# Altium schematic sheet Capacitor_Bank.SchDoc
size A3; SheetNumber: 2; SheetTotal: 2
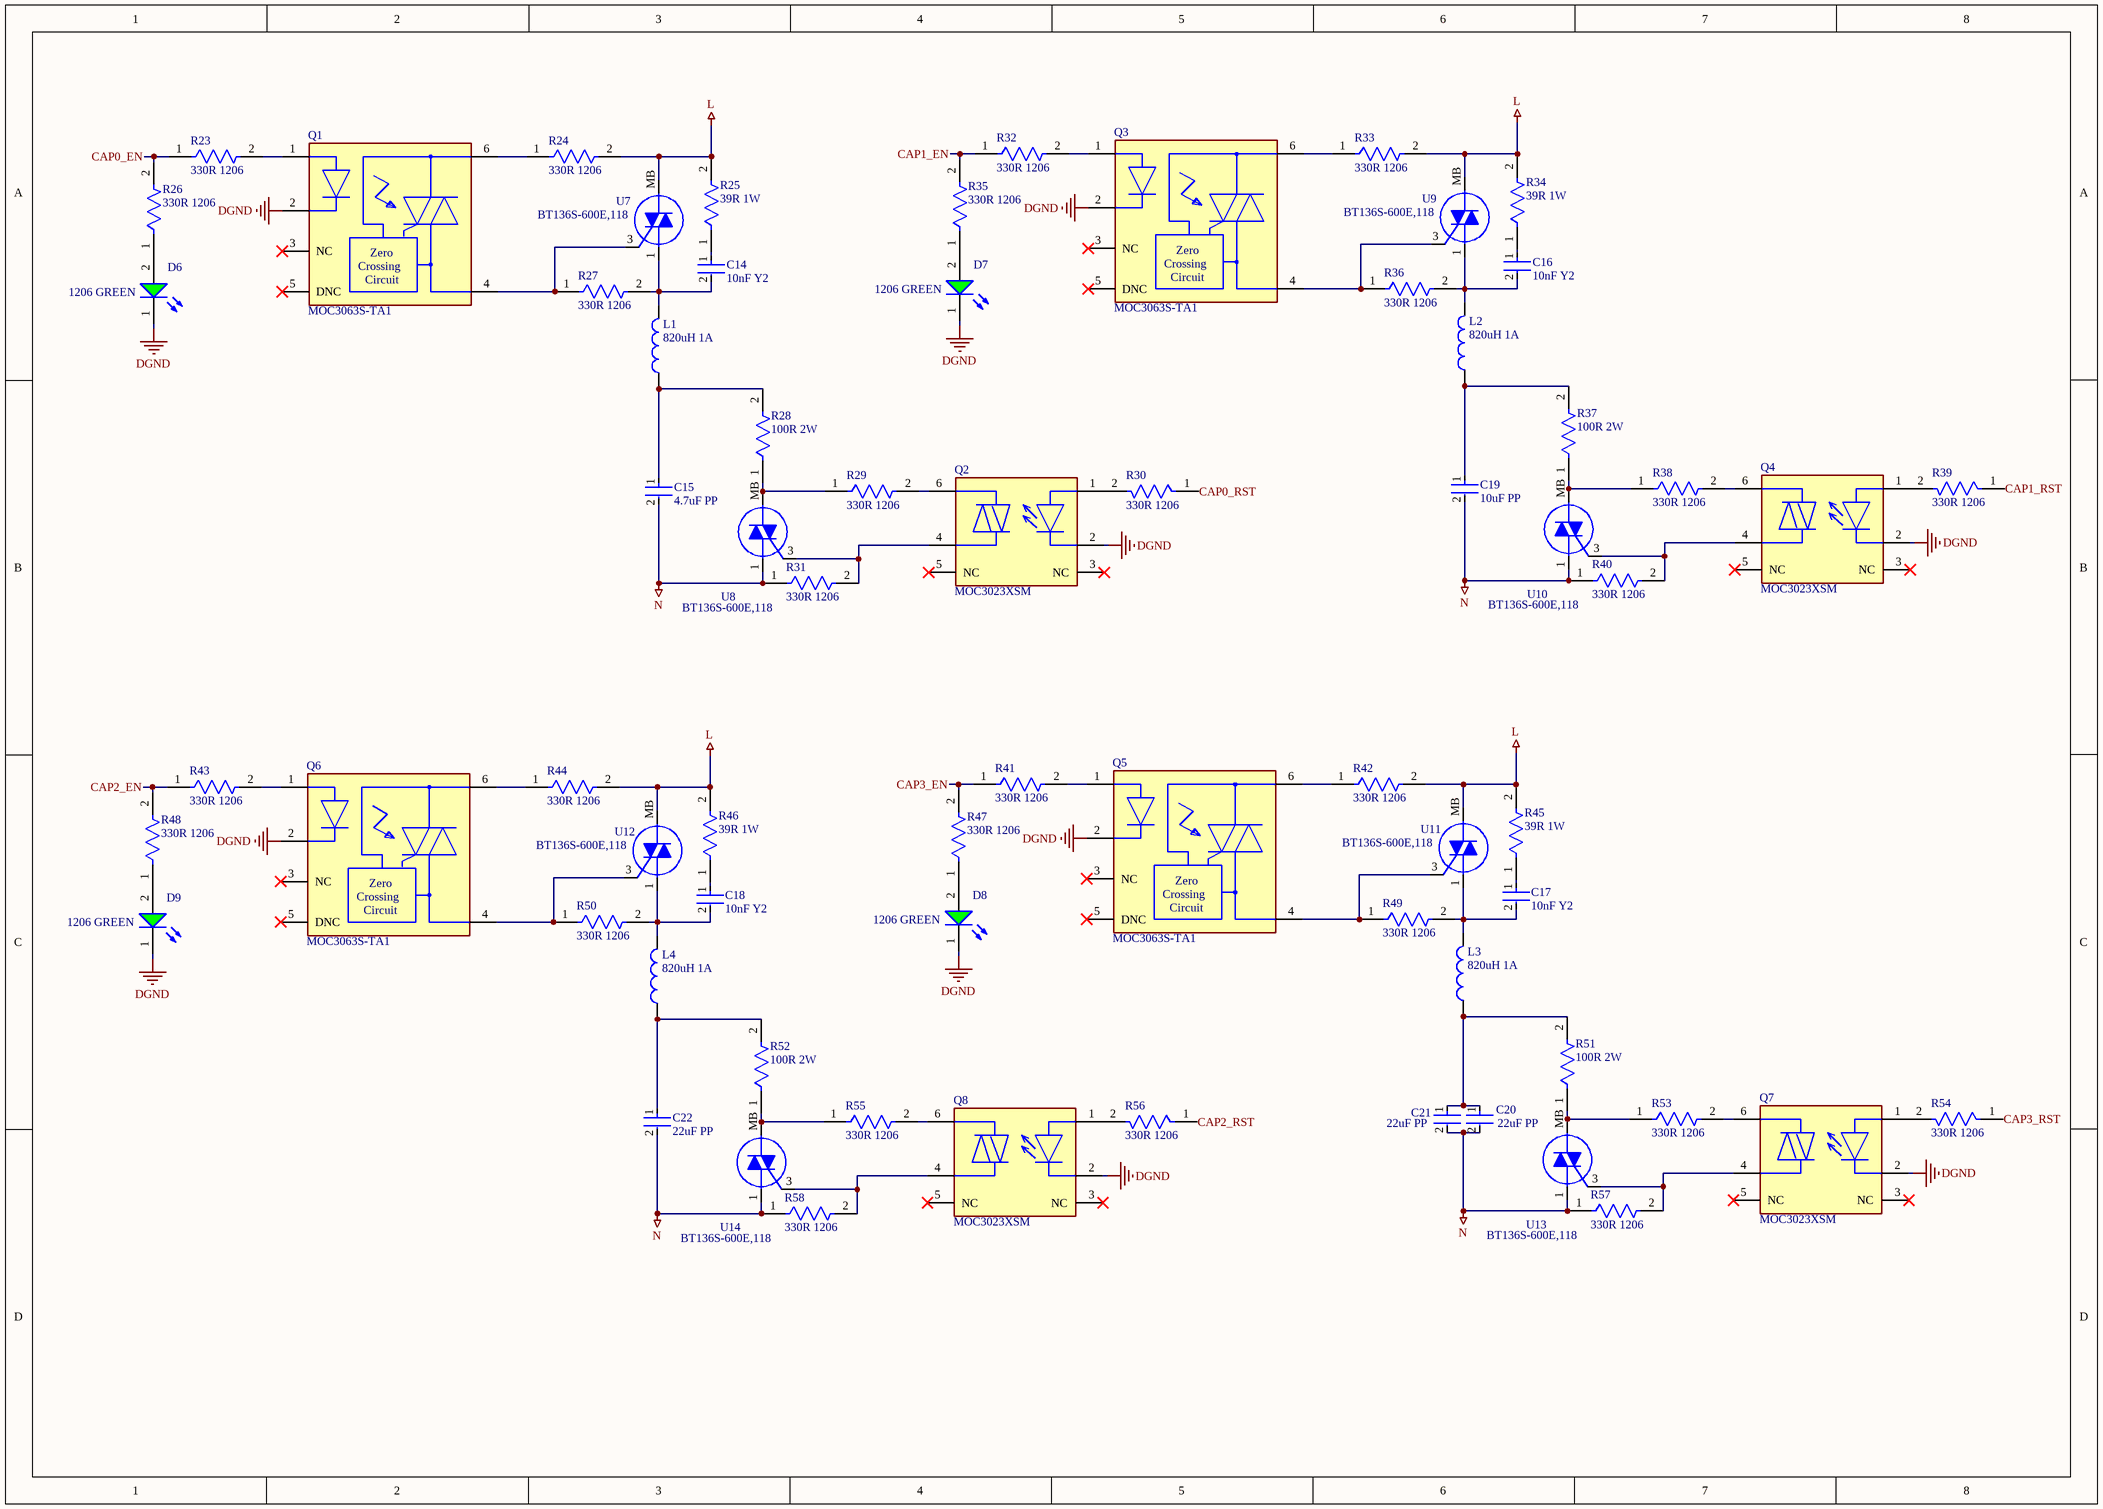
[diagram p0: Capacitor_Bank.SchDoc]

## Parts
C14  10nF Y2  [FP-R46KF310040P1M-MFG]
C15  4.7uF PP  [FP-C4BUY-MFG]
C16  10nF Y2  [FP-R46KF310040P1M-MFG]
C17  10nF Y2  [FP-R46KF310040P1M-MFG]
C18  10nF Y2  [FP-R46KF310040P1M-MFG]
C19  10uF PP  [FP-F17725102000-MFG]
C20  22uF PP  [FP-F17725102000-MFG]
C21  22uF PP  [FP-F17725102000-MFG]
C22  22uF PP  [FP-F17725102000-MFG]
D6  1206 GREEN  [WL-SMCW_1206_150120xx75000]
D7  1206 GREEN  [WL-SMCW_1206_150120xx75000]
D8  1206 GREEN  [WL-SMCW_1206_150120xx75000]
D9  1206 GREEN  [WL-SMCW_1206_150120xx75000]
L1  820uH 1A  [INDR62-500-1100X850X1100]
L2  820uH 1A  [INDR62-500-1100X850X1100]
L3  820uH 1A  [INDR62-500-1100X850X1100]
L4  820uH 1A  [INDR62-500-1100X850X1100]
Q1  MOC3063S-TA1  [FP-646BY-MFG]
Q2  MOC3023XSM  [FP-646BY-MFG]
Q3  MOC3063S-TA1  [FP-646BY-MFG]
Q4  MOC3023XSM  [FP-646BY-MFG]
Q5  MOC3063S-TA1  [FP-646BY-MFG]
Q6  MOC3063S-TA1  [FP-646BY-MFG]
Q7  MOC3023XSM  [FP-646BY-MFG]
Q8  MOC3023XSM  [FP-646BY-MFG]
R23  330R 1206  [FP-RMCF1206-IPC_A]
R24  330R 1206  [FP-RMCF1206-IPC_A]
R25  39R 1W  [FP-G001R1000FE1280-MFG]
R26  330R 1206  [FP-RMCF1206-IPC_A]
R27  330R 1206  [FP-RMCF1206-IPC_A]
R28  100R 2W  [FP-PR02000201003JA100-MFG]
R29  330R 1206  [FP-RMCF1206-IPC_A]
R30  330R 1206  [FP-RMCF1206-IPC_A]
R31  330R 1206  [FP-RMCF1206-IPC_A]
R32  330R 1206  [FP-RMCF1206-IPC_A]
R33  330R 1206  [FP-RMCF1206-IPC_A]
R34  39R 1W  [FP-G001R1000FE1280-MFG]
R35  330R 1206  [FP-RMCF1206-IPC_A]
R36  330R 1206  [FP-RMCF1206-IPC_A]
R37  100R 2W  [FP-PR02000201003JA100-MFG]
R38  330R 1206  [FP-RMCF1206-IPC_A]
R39  330R 1206  [FP-RMCF1206-IPC_A]
R40  330R 1206  [FP-RMCF1206-IPC_A]
R41  330R 1206  [FP-RMCF1206-IPC_A]
R42  330R 1206  [FP-RMCF1206-IPC_A]
R43  330R 1206  [FP-RMCF1206-IPC_A]
R44  330R 1206  [FP-RMCF1206-IPC_A]
R45  39R 1W  [FP-G001R1000FE1280-MFG]
R46  39R 1W  [FP-G001R1000FE1280-MFG]
R47  330R 1206  [FP-RMCF1206-IPC_A]
R48  330R 1206  [FP-RMCF1206-IPC_A]
R49  330R 1206  [FP-RMCF1206-IPC_A]
R50  330R 1206  [FP-RMCF1206-IPC_A]
R51  100R 2W  [FP-PR02000201003JA100-MFG]
R52  100R 2W  [FP-PR02000201003JA100-MFG]
R53  330R 1206  [FP-RMCF1206-IPC_A]
R54  330R 1206  [FP-RMCF1206-IPC_A]
R55  330R 1206  [FP-RMCF1206-IPC_A]
R56  330R 1206  [FP-RMCF1206-IPC_A]
R57  330R 1206  [FP-RMCF1206-IPC_A]
R58  330R 1206  [FP-RMCF1206-IPC_A]
U7  BT136S-600E,118  [IC_BT136S-600E,118]
U8  BT136S-600E,118  [IC_BT136S-600E,118]
U9  BT136S-600E,118  [IC_BT136S-600E,118]
U10  BT136S-600E,118  [IC_BT136S-600E,118]
U11  BT136S-600E,118  [IC_BT136S-600E,118]
U12  BT136S-600E,118  [IC_BT136S-600E,118]
U13  BT136S-600E,118  [IC_BT136S-600E,118]
U14  BT136S-600E,118  [IC_BT136S-600E,118]

## Nets
DGND: D6.1(K) D7.1(K) D8.1(K) D9.1(K) Q1.2(C) Q2.2(C) Q3.2(C) Q4.2(C) Q5.2(C) Q6.2(C) Q7.2(C) Q8.2(C)
L: R24.2 R25.2 R33.2 R34.2 R42.2 R44.2 R45.2 R46.2 U7.MB(T2) U9.MB(T2) U11.MB(T2) U12.MB(T2)
N: C15.2 C19.2 C20.2 C21.2 C22.2 R31.1 R40.1 R57.1 R58.1 U8.1(T1) U10.1(T1) U13.1(T1) U14.1(T1)
CAP0_EN: R23.1 R26.2
CAP0_RST: R30.1
CAP1_EN: R32.1 R35.2
CAP1_RST: R39.1
CAP2_EN: R43.1 R48.2
CAP2_RST: R56.1
CAP3_EN: R41.1 R47.2
CAP3_RST: R54.1
NetC14_1: C14.1 R25.1
NetC14_2: C14.2 L1.2 R27.2 U7.1(T1)
NetC15_1: C15.1 L1.1 R28.2
NetC16_1: C16.1 R34.1
NetC16_2: C16.2 L2.2 R36.2 U9.1(T1)
NetC17_1: C17.1 R45.1
NetC17_2: C17.2 L3.2 R49.2 U11.1(T1)
NetC18_1: C18.1 R46.1
NetC18_2: C18.2 L4.2 R50.2 U12.1(T1)
NetC19_1: C19.1 L2.1 R37.2
NetC20_1: C20.1 C21.1 L3.1 R51.2
NetC22_1: C22.1 L4.1 R52.2
NetD6_2: D6.2(A) R26.1
NetD7_2: D7.2(A) R35.1
NetD8_2: D8.2(A) R47.1
NetD9_2: D9.2(A) R48.1
NetQ1_1: Q1.1(A) R23.2
NetQ1_4: Q1.4(1_MAIN_TERM.) R27.1 U7.3(G)
NetQ1_6: Q1.6(2_MAIN_TERM.) R24.1
NetQ2_1: Q2.1(A) R30.2
NetQ2_4: Q2.4(1_MAIN_TERM) R31.2 U8.3(G)
NetQ2_6: Q2.6(2_MAIN_TERM) R29.2
NetQ3_1: Q3.1(A) R32.2
NetQ3_4: Q3.4(1_MAIN_TERM.) R36.1 U9.3(G)
NetQ3_6: Q3.6(2_MAIN_TERM.) R33.1
NetQ4_1: Q4.1(A) R39.2
NetQ4_4: Q4.4(1_MAIN_TERM) R40.2 U10.3(G)
NetQ4_6: Q4.6(2_MAIN_TERM) R38.2
NetQ5_1: Q5.1(A) R41.2
NetQ5_4: Q5.4(1_MAIN_TERM.) R49.1 U11.3(G)
NetQ5_6: Q5.6(2_MAIN_TERM.) R42.1
NetQ6_1: Q6.1(A) R43.2
NetQ6_4: Q6.4(1_MAIN_TERM.) R50.1 U12.3(G)
NetQ6_6: Q6.6(2_MAIN_TERM.) R44.1
NetQ7_1: Q7.1(A) R54.2
NetQ7_4: Q7.4(1_MAIN_TERM) R57.2 U13.3(G)
NetQ7_6: Q7.6(2_MAIN_TERM) R53.2
NetQ8_1: Q8.1(A) R56.2
NetQ8_4: Q8.4(1_MAIN_TERM) R58.2 U14.3(G)
NetQ8_6: Q8.6(2_MAIN_TERM) R55.2
NetR28_1: R28.1 R29.1 U8.MB(T2)
NetR37_1: R37.1 R38.1 U10.MB(T2)
NetR51_1: R51.1 R53.1 U13.MB(T2)
NetR52_1: R52.1 R55.1 U14.MB(T2)

Not connected (* = marked no-connect by the designer): Q1 3(NC)* 5(DNC)*; Q2 3(NC)* 5(NC)*; Q3 3(NC)* 5(DNC)*; Q4 3(NC)* 5(NC)*; Q5 3(NC)* 5(DNC)*; Q6 3(NC)* 5(DNC)*; Q7 3(NC)* 5(NC)*; Q8 3(NC)* 5(NC)*

## Notes on the sheet
- (in symbol CMP-07144-000013-1) Zero; Crossing; Circuit

## Library data of the parts
C14 C16-C18 = CMP-00212-22103502-1: C43Q1103K6SC000 / CAP.FILM 10nF 300VAC ±10% 15mm Radial 13x12x6 Y2 MKP Metallized Polypropylene (PP) THT; Voltage Rating (AC): 275V; Capacitance: 100nF; Tolerance: 20%; Lead Diameter: 600µm; Voltage Rating: 560V; NexarPartId: 22103502; Min Operating Temperature: -40°C; Height - Seated (Max): 12.0904mm; Mount: Through Hole; Dielectric Material: PP; Lead Pitch: 10mm; REACH SVHC: No SVHC; Depth: 5mm; Height: 6mm; RoHS: Compliant; Max Operating Temperature: 110°C; Termination: Radial; Case/Package: Radial; Packaging: Bulk; Voltage Rating (DC): 560V; Width: 5.9944mm; Length: 13mm; Schedule B: 8532250010; Dielectric: PP
C15 = CMP-03022-000053-1: CAP.FILM 4.7uF 305VAC ±10% 27.5mm Radial 32x33x18 X2 MKP Metallized Polypropylene (PP) THT C42Q2475KBAC000
C19 = CMP-02419-000004-1: C3D2K106KB00382 CAP.FILM 10uF 800VDC ±10% 27.5mm Radial 32x37x22 MKP Metallized Polypropylene (PP) THT; Dielectric Material: Polyester; Capacitance: 1uF; Voltage Rating (AC): 275V; Tolerance: 10%; RoHS Compliant: Yes; Number of Pins: 2
C20-C22 = CMP-02419-000004-1: C3D2H226JB00C00 CAP.FILM 22uF 500VDC ±5% 27.5mm Radial 32x37x22 MKP Metallized Polypropylene (PP) THT; Dielectric Material: Polyester; Capacitance: 1uF; Tolerance: 10%; Voltage Rating (AC): 275V; RoHS Compliant: Yes; Number of Pins: 2
D6-D9 = CMP-1426-00014-6: LED Uni-Color Green 515nm 2-Pin Chip 1206(3216Metric) T/R; Manufacturer Lifecycle Status: ACTIVE; Wavelength: 525nm; Max Junction Temperature (Tj): 95°C; Reverse Voltage: 5V; YEOL: 1 = Estimated lifetime > 10 years; Forward Current: 100mA; Luminous Intensity: 450mcd; Power Dissipation: 105mW; Test Current: 20mA; Lens Style: Clear, Rectangular; Viewing Angle: 140°; Forward Voltage: 3.2V; Height: 680µm; Packaging: Tape and Reel; RoHS: Compliant; Mount: Surface Mount; Max Operating Temperature: 85°C; Case/Package: 1206; Color: Green; Max Reverse Voltage (DC): 5V; Case Code (Metric): 3216; Min Operating Temperature: -40°C; Width: 1.6mm; Dominant Wavelength: 525nm; Length: 3.2mm; Lifecycle Status: Production; REACH SVHC: Unknown; Peak Wavelength: 515nm; Case Code (Imperial): 1206
L1-L4 = CMP-1747-00016-1: IND TH 820uH 1000mA ISAT=1000mA %10 F=5/10x15.5; Max Operating Temperature: 70 degC; PackageDescription: 2-Pin Radial Lead, Dia 8.5 mm, Pitch 5 mm; Min Operating Temperature: 0 degC; Mount: Through Hole; PackageReference: INDR62-500-1100X850X1100
Q1 Q3 Q5 Q6 = CMP-07144-000013-1: OPTOISOLATOR 4.17KV TRIAC 6SMD; Manufacturer Part Number: MOC3063SM; Manufacturer: ON Semiconductor; Standoff Height: 0.38mm; Max Junction Temp: +100°C; Power Dissipation: 250mW; Isolation Voltage: 4170Vrms; Reverse Voltage: 6V; Forward Current: 30mA; Forward Voltage: 1.3V; Temperature Range High: +85°C; Footprint Url: https://www.onsemi.com/pub/Collateral/646BY.PDF; Automotive: No; Device Class L2: Optocouplers; Digikey Description: OPTOISOLATOR 4.17KV TRIAC 6SMD; ComponentLink2URL: https://www.onsemi.com/pub/Collateral/MOC3163M-D.pdf; Octopart: https://octopart.com/moc3063sm-on+semiconductor-84330445; ComponentLink2Description: Datasheet; Package: 646BY; Device Class L1: Optoelectronics; Temperature Range Low: -40°C; Lead Free: Yes; RoHS: TRUE; Device Class L3: unset; Mouser Description: Triac & SCR Output Optocouplers 6P OPTO TRIAC; Height: 4.8mm; Category: Trans; Temperature: -40°C to +85°C
Q2 Q4 Q7 Q8 = CMP-00278-84330366-1: MOC3023XSM Triac Driver Output Optocoupler, 6-Pin DIP 400V Random Phase
R23 R24 R26 R27 R29-R33 R35 R36 R38-R44 R47-R50 R53-R58 = CMP-26527-006451-1: 330Ω ±5% 0.25W 1206 Thick Film Chip Resistor AEC-Q200 compliant; Max Power Dissipation: 250mW; Temperature Coefficient: 200ppm/°C; Case/Package: 1206; Height: 0.028inch; Contact Plating: Tin; Series: RMCF; Resistor Type: Thick Film; Military Standard: Not; Packaging: Tape and Reel; Resistance: 330R; Features: Automotive AEC-Q200; Width: 0.063inch; Length: 0.126inch; Tolerance: 5%; Mount: Surface Mount; Max Operating Temperature: 155°C; Radiation Hardening: No; Min Operating Temperature: -55°C; Construction: Rectangular; RoHS Compliant: Yes; Number of Terminations: 2; Depth: 1.6mm
R25 R34 R45 R46 = CMP-02408-000025-1: RES.WIREWOUND 1W-S 39 Ohms ±5% Axial Standard THT; Tolerance: 1%; Temperature Coefficient: 90ppm/°C; Case/Package: Ceramic; Construction: Cylindrical; Resistance: 39R; Diameter: 2.16mm; Series: G; Max Operating Temperature: 250°C; Lead Free: Lead Free; Resistor Type: Wirewound; Contact Plating: Tin; Mount: Through Hole; Radiation Hardening: No; RoHS Compliant: Yes; Termination: Axial; Min Operating Temperature: -65°C; Length: 7.14mm; Military Standard: Not; Packaging: Tape and Reel; Power Rating: 1W
R28 R37 R51 R52 = CMP-00030-42817933-1: RES.WIREWOUND 2W-S 100 Ohms ±5% Axial Standard THT KNP02SJ0101A10; Resistance: 100kΩ; Voltage Rating: 500V; Temperature Coefficient: 250ppm/°C; Case/Package: Conformal; Lead Free: Lead Free; Composition: Metal Film; Schedule B: 8533210090, 8533210090; Tolerance: 5%; RoHS: Compliant; Min Operating Temperature: -55°C; NexarPartId: 42817933; Diameter: 3.9mm; Max Operating Temperature: 155°C; Length: 12mm; Width: 3.9mm; Contact Plating: Tin; REACH SVHC: No SVHC; Operating Supply Voltage: 500V; Termination: Axial; Power Rating: 2W; Military Standard: Not; Radiation Hardening: No; Mount: Through Hole; Voltage Rating (DC): 500V
U7-U14 = CMP-070-000000-1: TRIAC Logic - Sensitive Gate 600 V 4 A Surface Mount DPAK; MF: WeEn Semiconductors; Value: *; Design Item ID: BT136S-600E,118; Source: BT136S-600E,118.SchLib; Check_prices: https://www.snapeda.com/parts/BT136S-600E,118/WeEn+Semiconductors/view-part/?ref=eda; SnapEDA_Link: https://www.snapeda.com/parts/BT136S-600E,118/WeEn+Semiconductors/view-part/?ref=snap; Component Type: Standard; MP: BT136S-600E,118; Package: TO-252-3 WeEn Semiconductors; Pin Count: 3